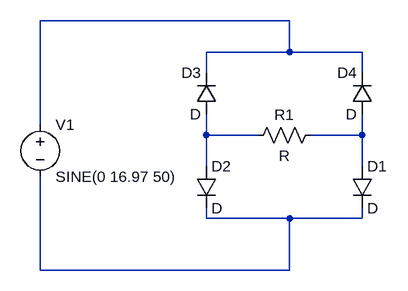
[diagram p0: schematic Version 1 Bench PSU.asc]
Version 1 Bench PSU.asc, the LTspice schematic file:
Version 4.1
SHEET 1 880 680
WIRE 448 -64 64 -64
WIRE 448 -16 448 -64
WIRE 448 -16 320 -16
WIRE 560 -16 448 -16
WIRE 320 16 320 -16
WIRE 560 16 560 -16
WIRE 64 96 64 -64
WIRE 320 112 320 80
WIRE 400 112 320 112
WIRE 560 112 560 80
WIRE 560 112 480 112
WIRE 320 160 320 112
WIRE 560 160 560 112
WIRE 320 240 320 224
WIRE 448 240 320 240
WIRE 560 240 560 224
WIRE 560 240 448 240
WIRE 64 320 64 176
WIRE 448 320 448 240
WIRE 448 320 64 320
SYMBOL voltage 64 80 R0
WINDOW 123 0 0 Left 0
WINDOW 39 0 0 Left 0
SYMATTR InstName V1
SYMATTR Value SINE(0 16.97 50)
SYMBOL diode 544 160 R0
SYMATTR InstName D1
SYMBOL diode 304 160 R0
SYMATTR InstName D2
SYMBOL diode 336 80 R180
WINDOW 0 24 64 Left 2
WINDOW 3 24 0 Left 2
SYMATTR InstName D3
SYMBOL diode 576 80 R180
WINDOW 0 24 64 Left 2
WINDOW 3 24 0 Left 2
SYMATTR InstName D4
SYMBOL res 384 128 R270
WINDOW 0 32 56 VTop 2
WINDOW 3 0 56 VBottom 2
SYMATTR InstName R1

The netlist it stands for:
* Version 1 Bench PSU.asc
V1 N001 N004 SINE(0 16.97 50)
D1 N003 N004 D
D2 N002 N004 D
D3 N002 N001 D
D4 N003 N001 D
R1 N002 N003 R
.model D D
.lib standard.dio
.backanno
.end